# Altium project RF recieving station Board.PrjPcb
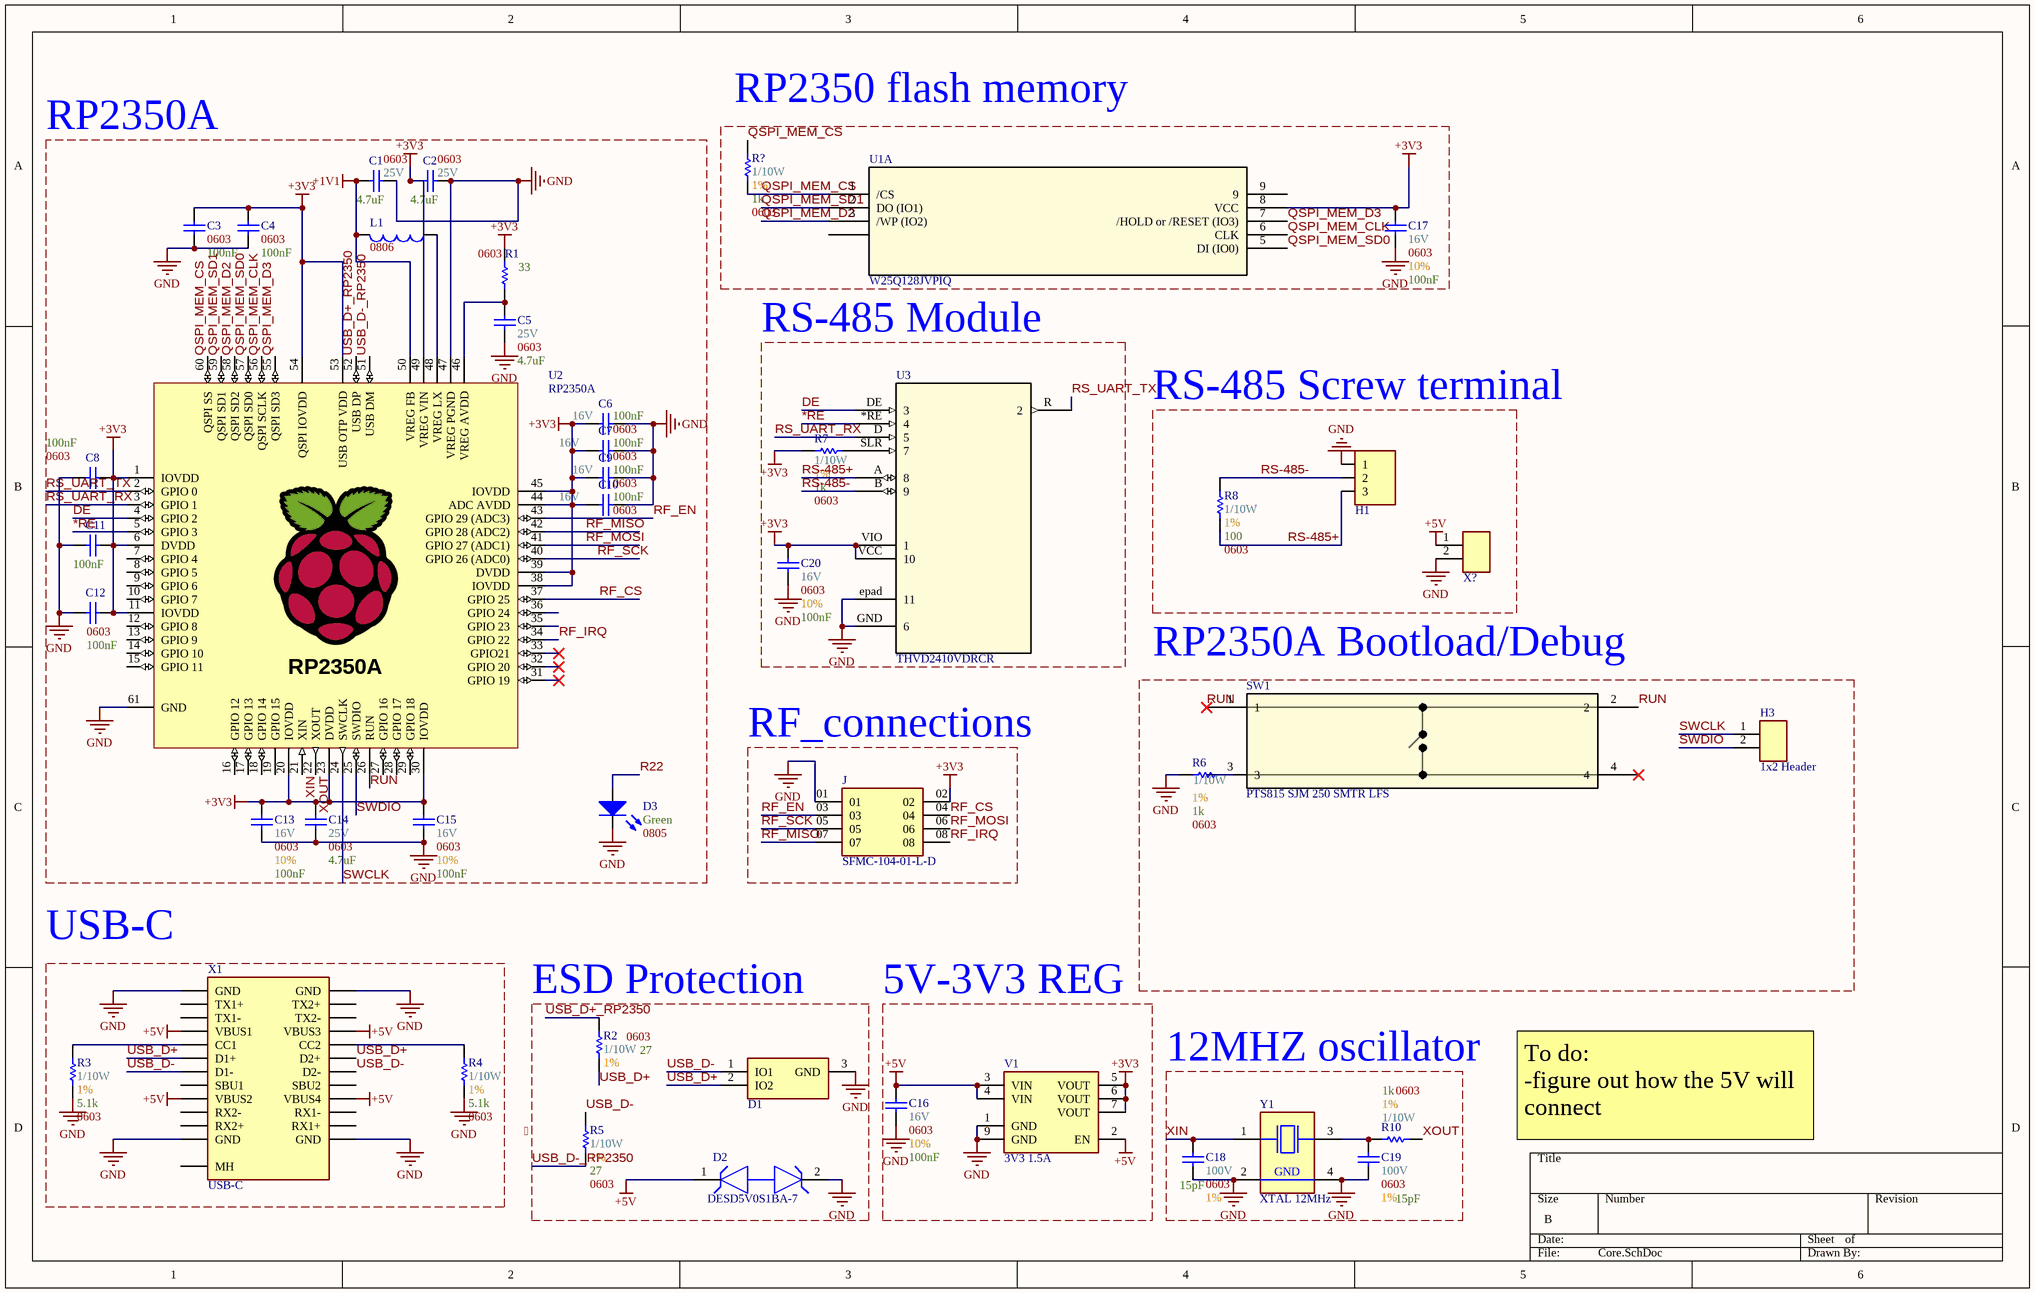
[diagram p0: Core.SchDoc]
1 sheet, 45 parts. Net scope: global (net labels, ports and power ports of the same name join across sheets).
Board file: RF recieving station Board.PcbDoc

## Sheet Core.SchDoc
size B; SheetNumber: 1; SheetTotal: 1

### Parts
C1  Max Voltage: 25V  Size Package: 0603  Capacitance: 4.7uF  [[Cap] SMD 0603]  (hidden comment: [Cap] 0603 4.7uF 10% 25V)
C2  Max Voltage: 25V  Size Package: 0603  Capacitance: 4.7uF  [[Cap] SMD 0603]  (hidden comment: [Cap] 0603 4.7uF 10% 25V)
C3  Size Package: 0603  Capacitance: 100nF  [[Cap] SMD 0603]  (hidden comment: [Cap] 0603 0.1uF 10% 16V)
C4  Size Package: 0603  Capacitance: 100nF  [[Cap] SMD 0603]  (hidden comment: [Cap] 0603 0.1uF 10% 16V)
C5  Max Voltage: 25V  Size Package: 0603  Capacitance: 4.7uF  [[Cap] SMD 0603]  (hidden comment: [Cap] 0603 4.7uF 10% 25V)
C6  Max Voltage: 16V  Size Package: 0603  Capacitance: 100nF  [[Cap] SMD 0603]  (hidden comment: [Cap] 0603 0.1uF 10% 16V)
C7  Max Voltage: 16V  Size Package: 0603  Capacitance: 100nF  [[Cap] SMD 0603]  (hidden comment: [Cap] 0603 0.1uF 10% 16V)
C8  Size Package: 0603  Capacitance: 100nF  [[Cap] SMD 0603]  (hidden comment: [Cap] 0603 0.1uF 10% 16V)
C9  Max Voltage: 16V  Size Package: 0603  Capacitance: 100nF  [[Cap] SMD 0603]  (hidden comment: [Cap] 0603 0.1uF 10% 16V)
C10  Max Voltage: 16V  Size Package: 0603  Capacitance: 100nF  [[Cap] SMD 0603]  (hidden comment: [Cap] 0603 0.1uF 10% 16V)
C11  Capacitance: 100nF  [[Cap] SMD 0603]  (hidden comment: [Cap] 0603 0.1uF 10% 16V)
C12  Size Package: 0603  Capacitance: 100nF  [[Cap] SMD 0603]  (hidden comment: [Cap] 0603 0.1uF 10% 16V)
C13  Max Voltage: 16V  Size Package: 0603  Tolerance: 10%  Capacitance: 100nF  [[Cap] SMD 0603]  (hidden comment: [Cap] 0603 0.1uF 10% 16V)
C14  Max Voltage: 25V  Size Package: 0603  Capacitance: 4.7uF  [[Cap] SMD 0603]  (hidden comment: [Cap] 0603 4.7uF 10% 25V)
C15  Max Voltage: 16V  Size Package: 0603  Tolerance: 10%  Capacitance: 100nF  [[Cap] SMD 0603]  (hidden comment: [Cap] 0603 0.1uF 10% 16V)
C16  Max Voltage: 16V  Size Package: 0603  Tolerance: 10%  Capacitance: 100nF  [[Cap] SMD 0603]  (hidden comment: [Cap] 0603 0.1uF 10% 16V)
C17  Max Voltage: 16V  Size Package: 0603  Tolerance: 10%  Capacitance: 100nF  [[Cap] SMD 0603]  (hidden comment: [Cap] 0603 0.1uF 10% 16V)
C18  Max Voltage: 100V  Size Package: 0603  Tolerance: 1%  Capacitance: 15pF  [[Cap] SMD 0603]  (hidden comment: [Cap] 0603 15pF 1% 100V)
C19  Max Voltage: 100V  Size Package: 0603  Tolerance: 1%  Capacitance: 15pF  [[Cap] SMD 0603]  (hidden comment: [Cap] 0603 15pF 1% 100V)
C20  Max Voltage: 16V  Size Package: 0603  Tolerance: 10%  Capacitance: 100nF  [[Cap] SMD 0603]  (hidden comment: [Cap] 0603 0.1uF 10% 16V)
D1  TPD2E2U06QDBZRQ1  [SOT95P237X95-3N]  (value not drawn)
D2  DESD5V0S1BA-7  [FP-SOD323-MFG]
D3  Color: Green  Size Package: 0805  [[LED] SMD 0805]  (hidden comment: [LED] SMD 0805 Green)
H1  1x3 Male  [[Molex] Shrouded 1x3 Male]  (value not drawn)
H3  1x2 Header  [[Header] 1x2 Male]
J  SFMC-104-01-L-D  [SAMTEC_SFMC-104-01-L-D]
L1  Package: 0806  [[Inductor] SMD 0806]  (hidden comment: [3.3uH] SMD 0806 2.1A)
R1  Resistance: 33  Size Package: 0603  [[Res] SMD 0603]  (hidden comment: [33] SMD 0603 0.5% 1/16W)
R2  Wattage: 1/10W  Tolerance: 1%  Resistance: 27  Size Package: 0603  [[Res] SMD 0603]  (hidden comment: [27] SMD 0603 1% 1/10W)
R3  Wattage: 1/10W  Tolerance: 1%  Resistance: 5.1k  Size Package: 0603  [[Res] SMD 0603]  (hidden comment: [5.1k] SMD 0603 1% 1/10W)
R4  Wattage: 1/10W  Tolerance: 1%  Resistance: 5.1k  Size Package: 0603  [[Res] SMD 0603]  (hidden comment: [5.1k] SMD 0603 1% 1/10W)
R5  Wattage: 1/10W  Tolerance: 1%  Resistance: 27  Size Package: 0603  [[Res] SMD 0603]  (hidden comment: [27] SMD 0603 1% 1/10W)
R6  Wattage: 1/10W  Tolerance: 1%  Resistance: 1k  Size Package: 0603  [[Res] SMD 0603]  (hidden comment: [1k] SMD 0603 1% 1/10W)
R7  Wattage: 1/10W  Tolerance: 1%  Resistance: 1k  Size Package: 0603  [[Res] SMD 0603]  (hidden comment: [1k] SMD 0603 1% 1/10W)
R8  Wattage: 1/10W  Tolerance: 1%  Resistance: 100  Size Package: 0603  [[Res] SMD 0603]  (hidden comment: [100] SMD 0603 1% 1/10W)
R10  Wattage: 1/10W  Tolerance: 1%  Resistance: 1k  Size Package: 0603  [[Res] SMD 0603]  (hidden comment: [1k] SMD 0603 1% 1/10W)
R?  Wattage: 1/10W  Tolerance: 1%  Resistance: 1k  Size Package: 0603  [[Res] SMD 0603]  (hidden comment: [1k] SMD 0603 1% 1/10W)
SW1  PTS815 SJM 250 SMTR LFS  [SW4_PTS815 SJM 250 SMTR LFS_CNK]
U1  W25Q128JVPIQ  [WSON_128JVPIQ_WIN]  (part A of 2)
U2  RP2350A  [[MCU] RP2350A]
U3  THVD2410VDRCR  [VSON10_DRC_TEX]
V1  3V3 1.5A  [[Linear] 3V3 1.5A]
X1  USB-C  [[USB] USB-C Right-Angle]
X?  2pin Screw Terminal  [[Screw Terminal] 2pin 5mm]  (value not drawn)
Y1  XTAL 12MHz  [[Crystal] SMD 12MHz]

### Blocks framed on the sheet
RP2350 flash memory: C17 R? U1
RP2350A: C1-C15 D3 L1 R1 U2
RS-485 Module: C20 R7 U3
RS-485 Screw terminal: H1 R8 X?
RP2350A Bootload/Debug: H3 R6 SW1
RF_connections: J
USB-C: R3 R4 X1
ESD Protection: D1 D2 R2 R5
5V-3V3 REG: C16 V1
12MHZ oscillator: C18 C19 R10 Y1

### Nets
+1V1: C1.2 L1.2 U2.50(VREG_FB)
+3V3: C2.2 C3.1 C4.1 C6.2 C7.2 C8.1 C9.2 C10.2 C11.2 C12.1 C13.1 C14.1 C15.2 C17.2 C20.2 J.02 R1.1 R7.1 U1.8(VCC) U2.1(IOVDD) U2.6(DVDD) U2.11(IOVDD) U2.20(IOVDD) U2.23(DVDD) U2.30(IOVDD) U2.38(IOVDD) U2.39(DVDD) U2.44(ADC_AVDD) U2.45(IOVDD) U2.49(VREG_VIN) U2.53(USB_OTP_VDD) U2.54(QSPI_IOVDD) U3.VCC(10) U3.VIO(1) V1.5(VOUT) V1.6(VOUT) V1.7(VOUT)
+5V: C16.2 D2.1 V1.2(EN) V1.3(VIN) V1.4(VIN) X1.A4(VBUS1) X1.A9(VBUS2) X1.B4(VBUS3) X1.B9(VBUS4) X?.1
GND: C1.1 C2.1 C3.2 C4.2 C5.1 C6.1 C7.1 C8.2 C9.1 C10.1 C11.1 C12.2 C13.2 C14.2 C15.1 C16.1 C17.1 C18.2 C19.1 C20.1 D1.3(GND) D2.2 D3.2(Cathode) H1.1 J.01 R3.1 R4.2 R6.1 U2.47(VREG_PGND) U2.61(GND) U3.epad(11) U3.GND(6) V1.1(GND) V1.9(GND) X1.A1(GND) X1.A12(GND) X1.B1(GND) X1.B12(GND) X?.2 Y1.2(GND) Y1.4(GND)
*RE: U2.5(GPIO_3) U3.*RE(4)
DE: U2.4(GPIO_2) U3.DE(3)
QSPI_MEM_CLK: U1.6(CLK) U2.56(QSPI_SCLK)
QSPI_MEM_CS: R?.1 R?.2 U1.1(/CS) U2.60(QSPI_SS)
QSPI_MEM_D2: U1.3(/WP_(IO2)) U2.58(QSPI_SD2)
QSPI_MEM_D3: U1.7(/HOLD_or_/RESET_(IO3)) U2.55(QSPI_SD3)
QSPI_MEM_SD0: U1.5(DI_(IO0)) U2.57(QSPI_SD0)
QSPI_MEM_SD1: U1.2(DO_(IO1)) U2.59(QSPI_SD1)
R22: D3.1(Anode)
RF_CS: J.04 U2.37(GPIO_25)
RF_EN: J.03 U2.43(GPIO_29_(ADC3))
RF_IRQ: J.08 U2.34(GPIO_22)
RF_MISO: J.07 U2.42(GPIO_28_(ADC2))
RF_MOSI: J.06 U2.41(GPIO_27_(ADC1))
RF_SCK: J.05 U2.40(GPIO_26_(ADC0))
RS-485+: H1.3 R8.2 U3.A(8)
RS-485-: H1.2 R8.1 U3.B(9)
RS_UART_RX: U2.3(GPIO_1) U3.D(5)
RS_UART_TX: U2.2(GPIO_0) U3.R(2)
RUN: SW1.1 SW1.2 U2.26(RUN)
SWCLK: H3.1 U2.24(SWCLK)
SWDIO: H3.2 U2.25(SWDIO)
USB_D+: D1.2(IO2) R2.2 X1.A6(D1+) X1.B6(D2+)
USB_D+_RP2350: R2.1 U2.52(USB_DP)
USB_D-: D1.1(IO1) R5.2 X1.A7(D1-) X1.B7(D2-)
USB_D-_RP2350: R5.1 U2.51(USB_DM)
XIN: C18.1 U2.21(XIN) Y1.1(XTAL1)
XOUT: R10.2 U2.22(XOUT)
NetC5_2: C5.2 R1.2 U2.46(VREG_AVDD)
NetC19_2: C19.2 R10.1 Y1.3(XTAL2)
NetL1_1: L1.1 U2.48(VREG_LX)
NetR3_2: R3.2 X1.A5(CC1)
NetR4_1: R4.1 X1.B5(CC2)
NetR6_2: R6.2 SW1.3
NetR7_2: R7.2 U3.SLR(7)

Not connected (* = marked no-connect by the designer): SW1 4*; U1 9 ?1; U2 7(GPIO_4) 8(GPIO_5) 9(GPIO_6) 10(GPIO_7) 12(GPIO_8) 13(GPIO_9) 14(GPIO_10) 15(GPIO_11) 16(GPIO_12) 17(GPIO_13) 18(GPIO_14) 19(GPIO_15) 27(GPIO_16) 28(GPIO_17) 29(GPIO_18) 31(GPIO_19)* 32(GPIO_20)* 33(GPIO21)* 35(GPIO_23) 36(GPIO_24); X1 A2(TX1+) A3(TX1-) A8(SBU1) A10(RX2-) A11(RX2+) B2(TX2+) B3(TX2-) B8(SBU2) B10(RX1-) B11(RX1+) MH

### Notes on the sheet
- To do:
  -figure out how the 5V will connect
- Labels drawn without touching a wire or pin: 

### Library data of the parts
C1 C2 C5 C14 = [Cap] 0603 4.7uF 10% 25V: GRM188R61E475KE11D; Supplier 1: DigiKey; Supplier Part Number 1: 490-7203-6-ND
C3 C4 C6-C13 C15-C17 C20 = [Cap] 0603 0.1uF 10% 16V: CC0603KRX7R7BB104; Supplier 1: DigiKey; Supplier Part Number 1: 311-1088-6-ND
C18 C19 = [Cap] 0603 15pF 1% 100V: GCM1885C2A150FA16D; Supplier 1: DigiKey; Supplier Part Number 1: 490-16416-1-ND
D1 = CMP-018-000010-3: USB ESD Protection; Manufacturer_Name: Texas Instruments; Arrow Price/Stock: https://www.arrow.com/en/products/tpd2e2u06qdbzrq1/texas-instruments?region=nac; Datasheet Link: http://www.ti.com/lit/gpn/tpd2e2u06-q1; Arrow Part Number: TPD2E2U06QDBZRQ1; Design Item ID: TPD2E2U06QDBZRQ1; Mouser Price/Stock: https://www.mouser.co.uk/ProductDetail/Texas-Instruments/TPD2E2U06QDBZRQ1?qs=ADSrZYdIRCdCCkTjX0u0BA%3D%3D; Mouser Part Number: 595-TPD2E2U06QDBZRQ1; Source: SamacSys.SchLib; Manufacturer_Part_Number: TPD2E2U06QDBZRQ1; Height: 0.95mm
D2 = CMP-12828-000011-1: TVS DIODE 5V 14V SOD323; Manufacturer: Diodes Inc; Capacitance: 35pF; Direction: Bidirectional; Breakdown Voltage: 5.5V; Number Of Channels: 1; Standoff Height: 0.05mm; Max Junction Temp: +150°C; Peak Pulse Current: 12A; Value: 35pF; Peak Pulse Power: 130W; ComponentLink2Description: Datasheet; Manufacturer Part Number: DESD5V0S1BA-7; Mouser Description: TVS Diodes / ESD Suppressors Low Cap BI TVS Diode 130W 12A 200mW; Digikey Description: TVS DIODE 5V 14V SOD323; Temperature: -65°C to +150°C; Clamping Voltage: 14V; Device Class L2: TVS Diodes; Temperature Range Low: -65°C; Octopart: https://octopart.com/desd5v0s1ba-7-diodes+inc.-23272867; Lead Free: Yes; Package: SOD323; Temperature Range High: +150°C; Automotive: No; Device Class L1: Circuit Protection; RoHS: TRUE; Height: 1.2mm; Reverse Standoff Voltage: 5V; Category: Diode; Device Class L3: unset; ComponentLink2URL: https://www.diodes.com/assets/Datasheets/ds31275.pdf
D3 = [LED] SMD 0805 Green: LG R971-KN-1-0-20-R18; Supplier 1: DigiKey; Supplier Part Number 1: 475-LGR971-KN-1CT-ND
H1 = [Molex] Shrouded 1x3 Male: 070543-0037 / Mates with 005057-9403; Supplier 1: DigiKey; Supplier Part Number 1: WM4825-ND
H3 = [Header] 1x2 Male: 2.54mm pitch
J = SFMC-104-01-L-D: MF: Samtec; Price: None; Package: None; Availability: Unavailable; Value: *; MP: SFMC-104-01-L-D
L1 = [3.3uH] SMD 0806 2.1A: AOTA-B201610S3R3-101-T; Supplier 1: DigiKey; Supplier Part Number 1: 535-AOTA-B201610S3R3-101-TCT-ND
R1 = [33] SMD 0603 0.5% 1/16W: RR0816Q-330-D; Supplier 1: DigiKey; Supplier Part Number 1: RR08Q33DDKR-ND
R2 R5 = [27] SMD 0603 1% 1/10W: MCT06030C2709FP500; Supplier 1: DigiKey; Supplier Part Number 1: 749-1631-1-ND
R3 R4 = [5.1k] SMD 0603 1% 1/10W: RC0603FR-075K1L; Supplier 1: DigiKey; Supplier Part Number 1: 311-5.10KHRCT-ND
R6 R7 R10 R? = [1k] SMD 0603 1% 1/10W: RMCF0603FT1K00; Supplier 1: DigiKey; Supplier Part Number 1: RMCF0603FT1K00DKR-ND
R8 = [100] SMD 0603 1% 1/10W: RC0603FR-07100RL; Supplier 1: DigiKey; Supplier Part Number 1: 311-100HRDKR-ND
SW1 = PTS815 SJM 250 SMTR LFS: Description; Manufacturer_Name: C&K Components; Copyright: Copyright (C) 2026 Ultra Librarian. All rights reserved.; Manufacturer_Part_Number: PTS815 SJM 250 SMTR LFS; RefDes: RefDes; Type: Type
U1 = W25Q128JVPIQ: Description; Manufacturer_Name: Winbond; Copyright: Copyright (C) 2025 Ultra Librarian. All rights reserved.; Manufacturer_Part_Number: W25Q128JVPIQ; RefDes: RefDes; Type: Type
U2 = [MCU] RP2350A: QFN-60 Package; Supplier 1: DigiKey; Supplier Part Number 1: 2648-SC1509-A4CT-ND
U3 = THVD2410VDRCR: 3-V to 5.5-V, 1-Mbps, half-duplex RS-485 transceiver with flexible IO and 70-V bus-fault protection 10-VSON -40 to 125; Manufacturer_Name: Texas Instruments; Type: Interface; Copyright: Copyright (C) 2026 Ultra Librarian. All rights reserved.; Manufacturer_Part_Number: THVD2410VDRCR; RefDes: RefDes
V1 = [Linear] 3V3 1.5A: AP7362A-33SP-13; Supplier 1: DigiKey; Supplier Part Number 1: AP7362A-33SP-13DICT-ND
X1 = [USB] Type-C Right-Angle: Supplier 1: DigiKey; Supplier Part Number 1: 670-3104-1-ND
X? = [Screw Terminal] 2pin: TB002-500-02BE; Supplier 1: DigiKey; Supplier Part Number 1: 102-6145-ND
Y1 = [Crystal] SMD 12MHz: 815-ABM8-272-T3; Supplier 1: DigiKey; Supplier Part Number 1: 535-ABM8-272-T3CT-ND